# Altium schematic sheet Top_Sheet.SchDoc
size A4; SheetNumber: 1; SheetTotal: 6
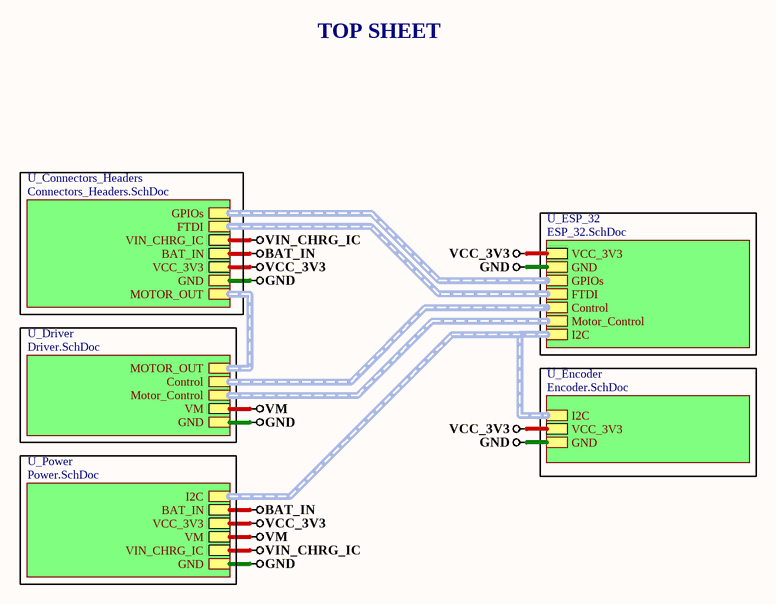
[diagram p0: Top_Sheet.SchDoc]

## Sub-sheets
U_Connectors_Headers = Connectors_Headers.SchDoc: FTDI (harness FTDI), BAT_IN, VCC_3V3, GND, GPIOs (harness GPIOs), MOTOR_OUT (harness MOTOR_OUT), VIN_CHRG_IC
U_Driver = Driver.SchDoc: Motor_Control (harness Motor_Control), Control (harness Control), VM, GND, MOTOR_OUT (harness MOTOR_OUT)
U_Encoder = Encoder.SchDoc: VCC_3V3, GND, I2C (harness Encoder)
U_ESP_32 = ESP_32.SchDoc: Motor_Control (harness Motor_Control), Control (harness Control), I2C (harness Encoder), FTDI (harness FTDI), VCC_3V3, GND, GPIOs (harness GPIOs)
U_Power = Power.SchDoc: BAT_IN, VCC_3V3, VM, GND, I2C (harness I2C), VIN_CHRG_IC

## Nets
BAT_IN: sheet U_Power/BAT_IN, sheet U_Connectors_Headers/BAT_IN
GND: sheet U_Power/GND, sheet U_Encoder/GND, sheet U_ESP_32/GND, sheet U_Connectors_Headers/GND, sheet U_Driver/GND
VCC_3V3: sheet U_Power/VCC_3V3, sheet U_Encoder/VCC_3V3, sheet U_ESP_32/VCC_3V3, sheet U_Connectors_Headers/VCC_3V3
VIN_CHRG_IC: sheet U_Power/VIN_CHRG_IC, sheet U_Connectors_Headers/VIN_CHRG_IC
VM: sheet U_Power/VM, sheet U_Driver/VM

## Buses and harness runs
harness sheet U_Connectors_Headers/FTDI = sheet U_ESP_32/FTDI
harness sheet U_Connectors_Headers/GPIOs = sheet U_ESP_32/GPIOs
harness sheet U_Connectors_Headers/MOTOR_OUT = sheet U_Driver/MOTOR_OUT
harness sheet U_Driver/Control = sheet U_ESP_32/Control
harness sheet U_Driver/Motor_Control = sheet U_ESP_32/Motor_Control
harness sheet U_Encoder/I2C = sheet U_ESP_32/I2C = sheet U_Power/I2C

## Notes on the sheet
- TOP SHEET
- File:
- Title:
- Date:
- Page
- Num:
- Total:
- Drawn By: Huzaifa Ali